# Altium schematic sheet Sheet2.SchDoc
size A; SheetNumber: 2; SheetTotal: 7
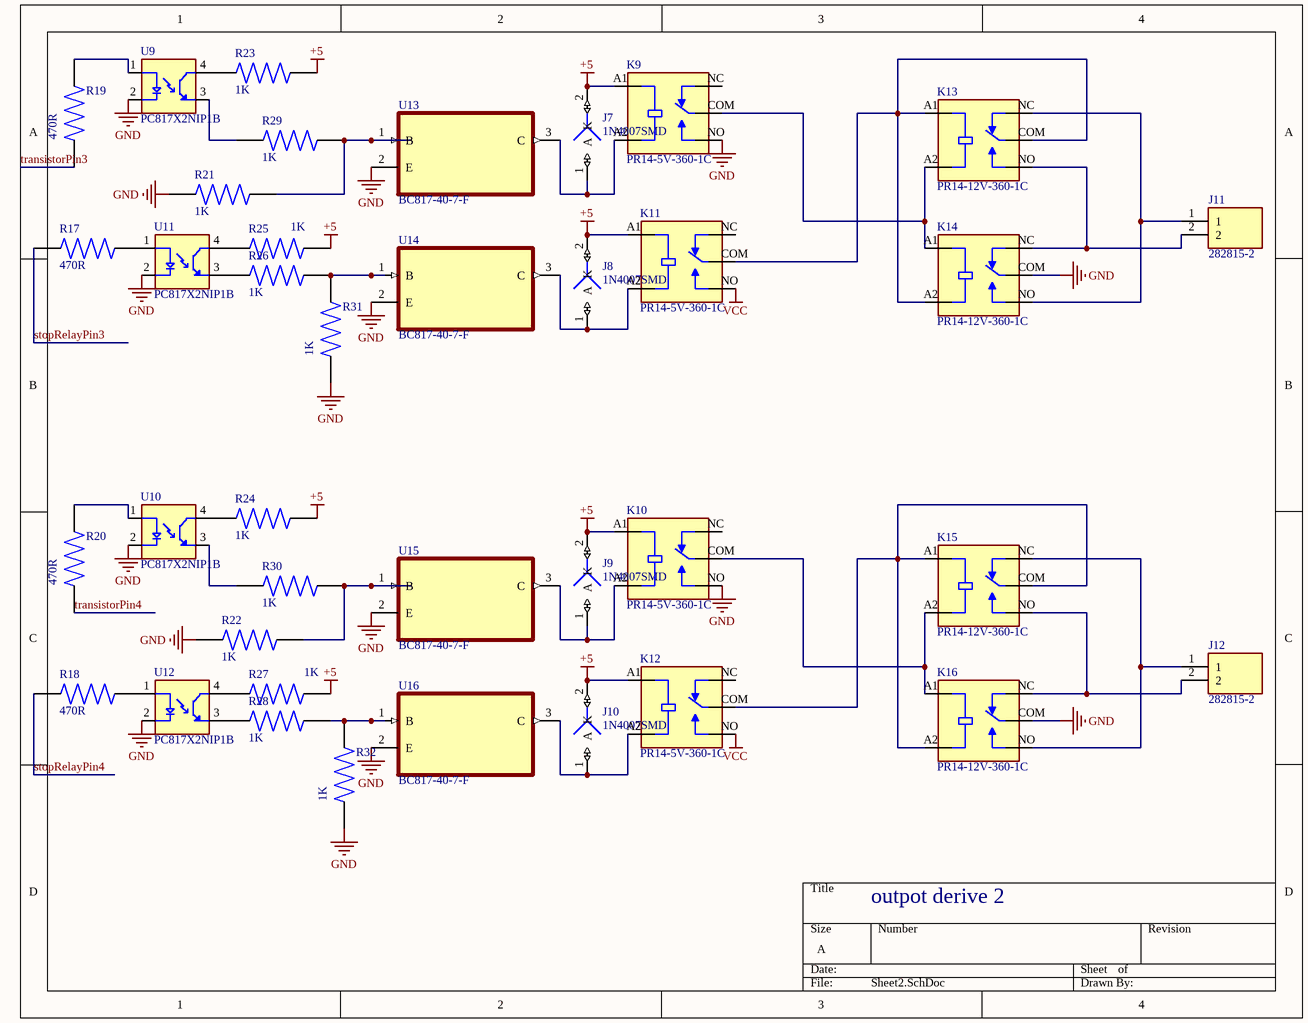
[diagram p0: Sheet2.SchDoc]

## Parts
J7  1N4007SMD  [C1206]
J8  1N4007SMD  [C1206]
J9  1N4007SMD  [C1206]
J10  1N4007SMD  [C1206]
J11  282815-2  [TE_282815-2]
J12  282815-2  [TE_282815-2]
K9  PR14-5V-360-1C  [RELAY_PR14-5V-360-1C]
K10  PR14-5V-360-1C  [RELAY_PR14-5V-360-1C]
K11  PR14-5V-360-1C  [RELAY_PR14-5V-360-1C]
K12  PR14-5V-360-1C  [RELAY_PR14-5V-360-1C]
K13  PR14-12V-360-1C  [RELAY_PR14-5V-360-1C]
K14  PR14-12V-360-1C  [RELAY_PR14-5V-360-1C]
K15  PR14-12V-360-1C  [RELAY_PR14-5V-360-1C]
K16  PR14-12V-360-1C  [RELAY_PR14-5V-360-1C]
R17  470R  [RESC2012X65N]
R18  470R  [RESC2012X65N]
R19  470R  [RESC2012X65N]
R20  470R  [RESC2012X65N]
R21  1K  [RESC2012X65N]
R22  1K  [RESC2012X65N]
R23  1K  [RESC2012X65N]
R24  1K  [RESC2012X65N]
R25  1K  [RESC2012X65N]
R26  1K  [RESC2012X65N]
R27  1K  [RESC2012X65N]
R28  1K  [RESC2012X65N]
R29  1K  [RESC2012X65N]
R30  1K  [RESC2012X65N]
R31  1K  [RESC2012X65N]
R32  1K  [RESC2012X65N]
U9  PC817X2NIP1B  [SOIC254P960X420-4N]
U10  PC817X2NIP1B  [SOIC254P960X420-4N]
U11  PC817X2NIP1B  [SOIC254P960X420-4N]
U12  PC817X2NIP1B  [SOIC254P960X420-4N]
U13  BC817-40-7-F  [SOT103P240X110-3N]
U14  BC817-40-7-F  [SOT103P240X110-3N]
U15  BC817-40-7-F  [SOT103P240X110-3N]
U16  BC817-40-7-F  [SOT103P240X110-3N]

## Nets
+5: J7.2(K) J8.2(K) J9.2(K) J10.2(K) K9.A1(COIL1) K10.A1(COIL1) K11.A1(COIL1) K12.A1(COIL1) R23.2 R24.2 R25.2 R27.2
GND: K9.NO K10.NO K14.COM K16.COM R21.1 R22.1 R31.1 R32.1 U9.2(C) U10.2(C) U11.2(C) U12.2(C) U13.2(E) U14.2(E) U15.2(E) U16.2(E)
VCC: K11.NO K12.NO
stopRelayPin3: R17.1
stopRelayPin4: R18.1
transistorPin3: R19.1
transistorPin4: R20.1
NetJ7_1: J7.1(A) K9.A2(COIL2) U13.3(C)
NetJ8_1: J8.1(A) K11.A2(COIL2) U14.3(C)
NetJ9_1: J9.1(A) K10.A2(COIL2) U15.3(C)
NetJ10_1: J10.1(A) K12.A2(COIL2) U16.3(C)
NetJ11_1: J11.1 K13.NC K14.NO
NetJ11_2: J11.2 K13.NO K14.NC
NetJ12_1: J12.1 K15.NC K16.NO
NetJ12_2: J12.2 K15.NO K16.NC
NetK9_COM: K9.COM K13.A2(COIL2) K14.A1(COIL1)
NetK10_COM: K10.COM K15.A2(COIL2) K16.A1(COIL1)
NetK11_COM: K11.COM K13.A1(COIL1) K13.COM K14.A2(COIL2)
NetK12_COM: K12.COM K15.A1(COIL1) K15.COM K16.A2(COIL2)
NetR17_2: R17.2 U11.1(A)
NetR18_2: R18.2 U12.1(A)
NetR19_2: R19.2 U9.1(A)
NetR20_2: R20.2 U10.1(A)
NetR21_2: R21.2 R29.2 U13.1(B)
NetR22_2: R22.2 R30.2 U15.1(B)
NetR23_1: R23.1 U9.4(CT)
NetR24_1: R24.1 U10.4(CT)
NetR25_1: R25.1 U11.4(CT)
NetR26_1: R26.1 U11.3(ET)
NetR26_2: R26.2 R31.2 U14.1(B)
NetR27_1: R27.1 U12.4(CT)
NetR28_1: R28.1 U12.3(ET)
NetR28_2: R28.2 R32.2 U16.1(B)
NetR29_1: R29.1 U9.3(ET)
NetR30_1: R30.1 U10.3(ET)

Not connected (* = marked no-connect by the designer): K9 NC; K10 NC; K11 NC; K12 NC

## Notes on the sheet
- outpot derive 2

## Library data of the parts
J7-J10 = 1N4007SMD: RECTIFIER, 1KV, 1A, DO-214AC; Available until stocks are exhausted Alternatives available; MF: Multicomp Pro; Availability: Not in stock; Check_prices: https://www.snapeda.com/parts/1N4007SMD/Multicomp/view-part/?ref=eda; Package: None; SnapEDA_Link: https://www.snapeda.com/parts/1N4007SMD/Multicomp/view-part/?ref=snap; MP: 1N4007SMD; Price: None; Value: *
J11 J12 = 282815-2: 2 Position Terminal Block Header, Male Pins, Shrouded (2 Side) 0.200 (5.08mm) 90Â°, Right Angle - Through Hole; MF: TE Connectivity; SnapEDA_Link: https://www.snapeda.com/parts/282815-2/TE+Connectivity+AMP+Connectors/view-part/?ref=snap; Package: None; Value: *; MP: 282815-2; EU_RoHS_Compliance: Compliant with Exemptions; Check_prices: https://www.snapeda.com/parts/282815-2/TE+Connectivity+AMP+Connectors/view-part/?ref=eda
K9-K16 = PR14-5V-360-1C: 19 x 15.5 x 15.8 mm, 5 V, 10 A, SPDT (1 Form C), Power Relay; MF: Same Sky; SnapEDA_Link: https://www.snapeda.com/parts/PR14-5V-360-1C/Same+Sky/view-part/?ref=snap; Package: None; Value: *; MP: PR14-5V-360-1C; Check_prices: https://www.snapeda.com/parts/PR14-5V-360-1C/Same+Sky/view-part/?ref=eda
R17-R32 = RN73C2A3K3BTDF: TE; IND Devices; Resistors; RN 0805 3K3 0.1% 10PPM 1K RL | TE Connectivity RN73C2A3K3BTDF; Power_Rating: .1 W; Resistance: 3.3K; Voltage_Rating: 100 V; Tolerance: .1%; SnapEDA_Link: https://www.snapeda.com/parts/RN73C2A3K3BTDF/TE+Connectivity/view-part/?ref=snap; Package: 0805; Value: *; MF: TE Connectivity; MP: RN73C2A3K3BTDF; EU_RoHS_Compliance: Compliant; Check_prices: https://www.snapeda.com/parts/RN73C2A3K3BTDF/TE+Connectivity/view-part/?ref=eda
U9-U12 = PC817X2NIP1B: Optocoupler DC-IN 1-CH Transistor DC-OUT 4-Pin DIP SMD T/R; MF: Sharp Microelectronics; SnapEDA_Link: https://www.snapeda.com/parts/PC817X2NIP1B/Sharp+Microelectronics/view-part/?ref=snap; Package: SMD-4 Sharp Microelectronics; Value: *; MP: PC817X2NIP1B; Check_prices: https://www.snapeda.com/parts/PC817X2NIP1B/Sharp+Microelectronics/view-part/?ref=eda
U13-U16 = BC817-40-7-F: Bipolar (BJT) Transistor NPN 45 V 500 mA 100MHz 310 mW Surface Mount SOT-23-3; MF: Diodes Inc.; MP: BC817-40-7-F; Price: None; Package: SOT-23 Diodes Inc.; Check_prices: https://www.snapeda.com/parts/BC817-40-7-F/Diodes+Inc./view-part/?ref=eda; Value: *; Availability: In Stock; Purchase-URL: https://pricing.snapeda.com/search/part/BC817-40-7-F/?ref=eda; SnapEDA_Link: https://www.snapeda.com/parts/BC817-40-7-F/Diodes+Inc./view-part/?ref=snap